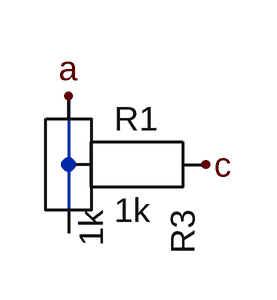
[diagram p0: schematic same_instance_pin_inside.asc]
same_instance_pin_inside.asc, the LTspice schematic file:
Version 4
SHEET 1 880 680
WIRE 96 96 96 192
FLAG 96 96 a
FLAG 192 144 c
SYMBOL res 96 144 R0
SYMATTR InstName R1
SYMATTR Value 1k
SYMBOL res 144 144 R90
SYMATTR InstName R3
SYMATTR Value 1k

The netlist it stands for:
* same_instance_pin_inside.asc
R1 a a 1k
R3 c a 1k
.backanno
.end